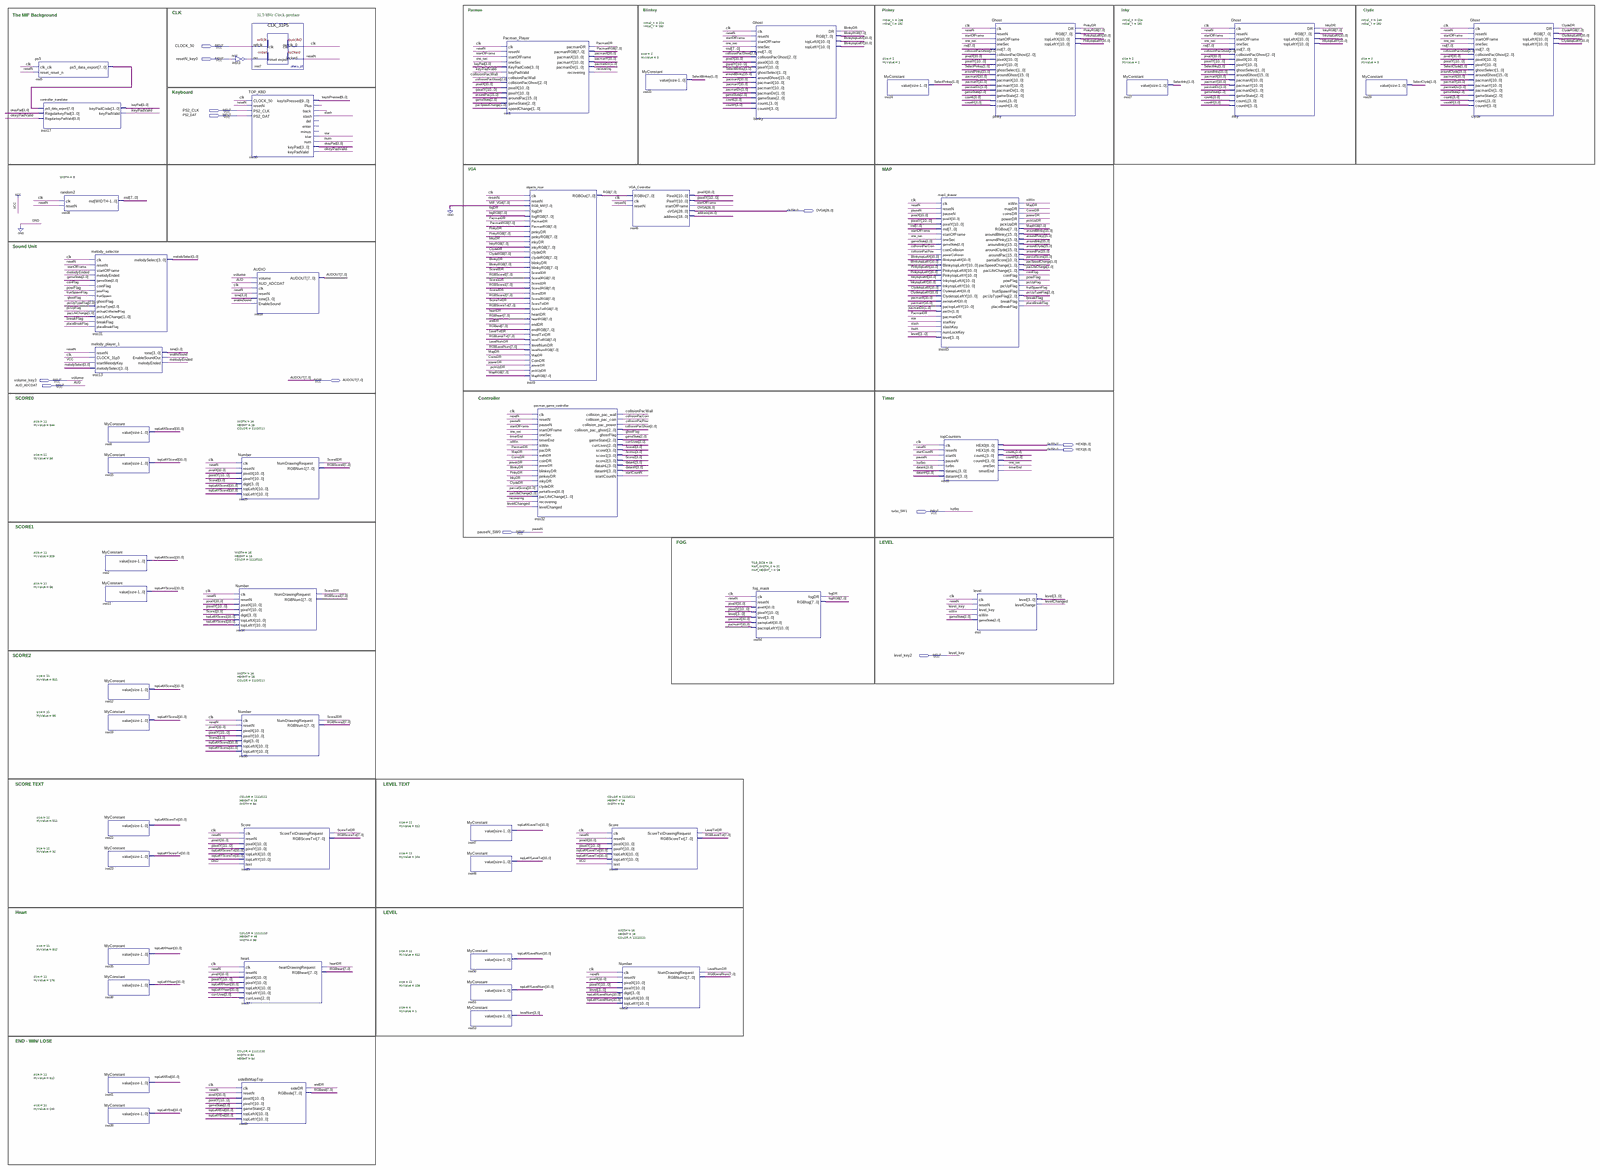
[diagram p0: schematic sheet, whole]
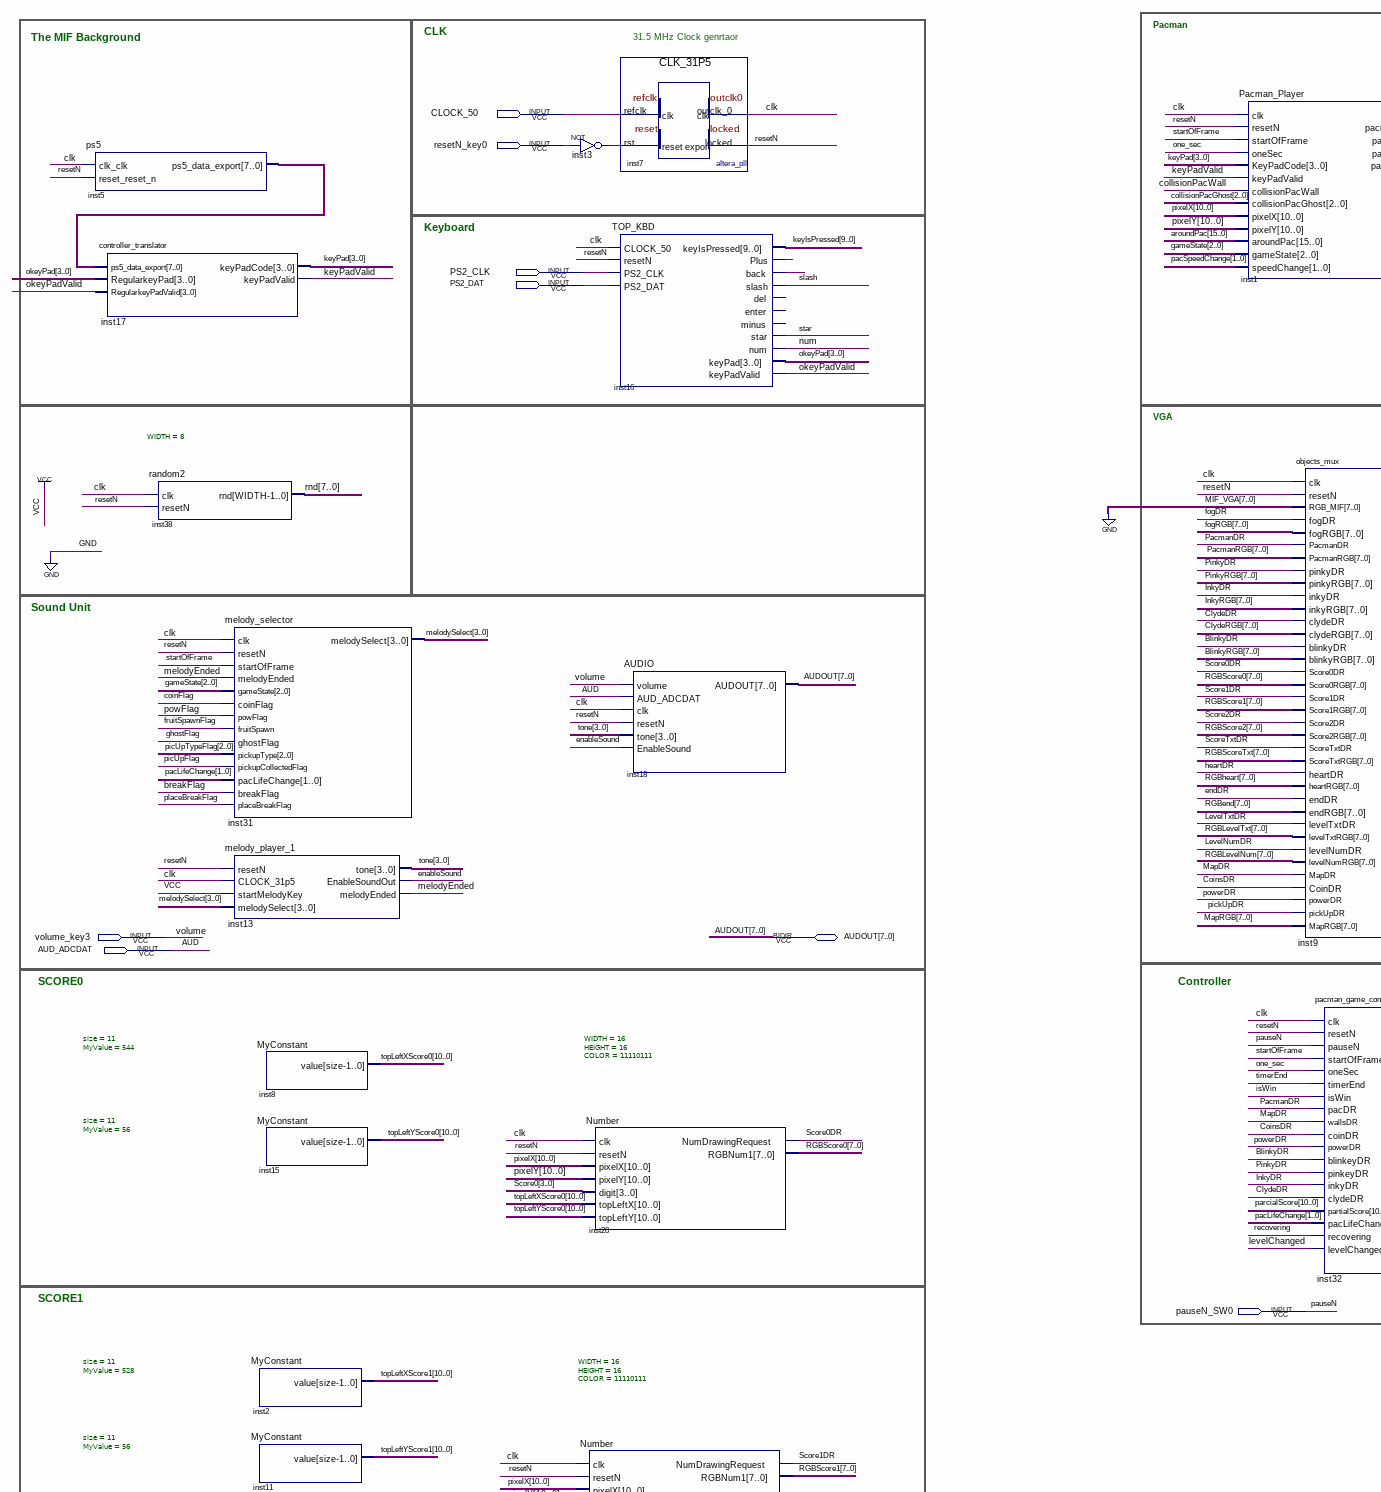
[diagram p1: schematic sheet, upper left part]
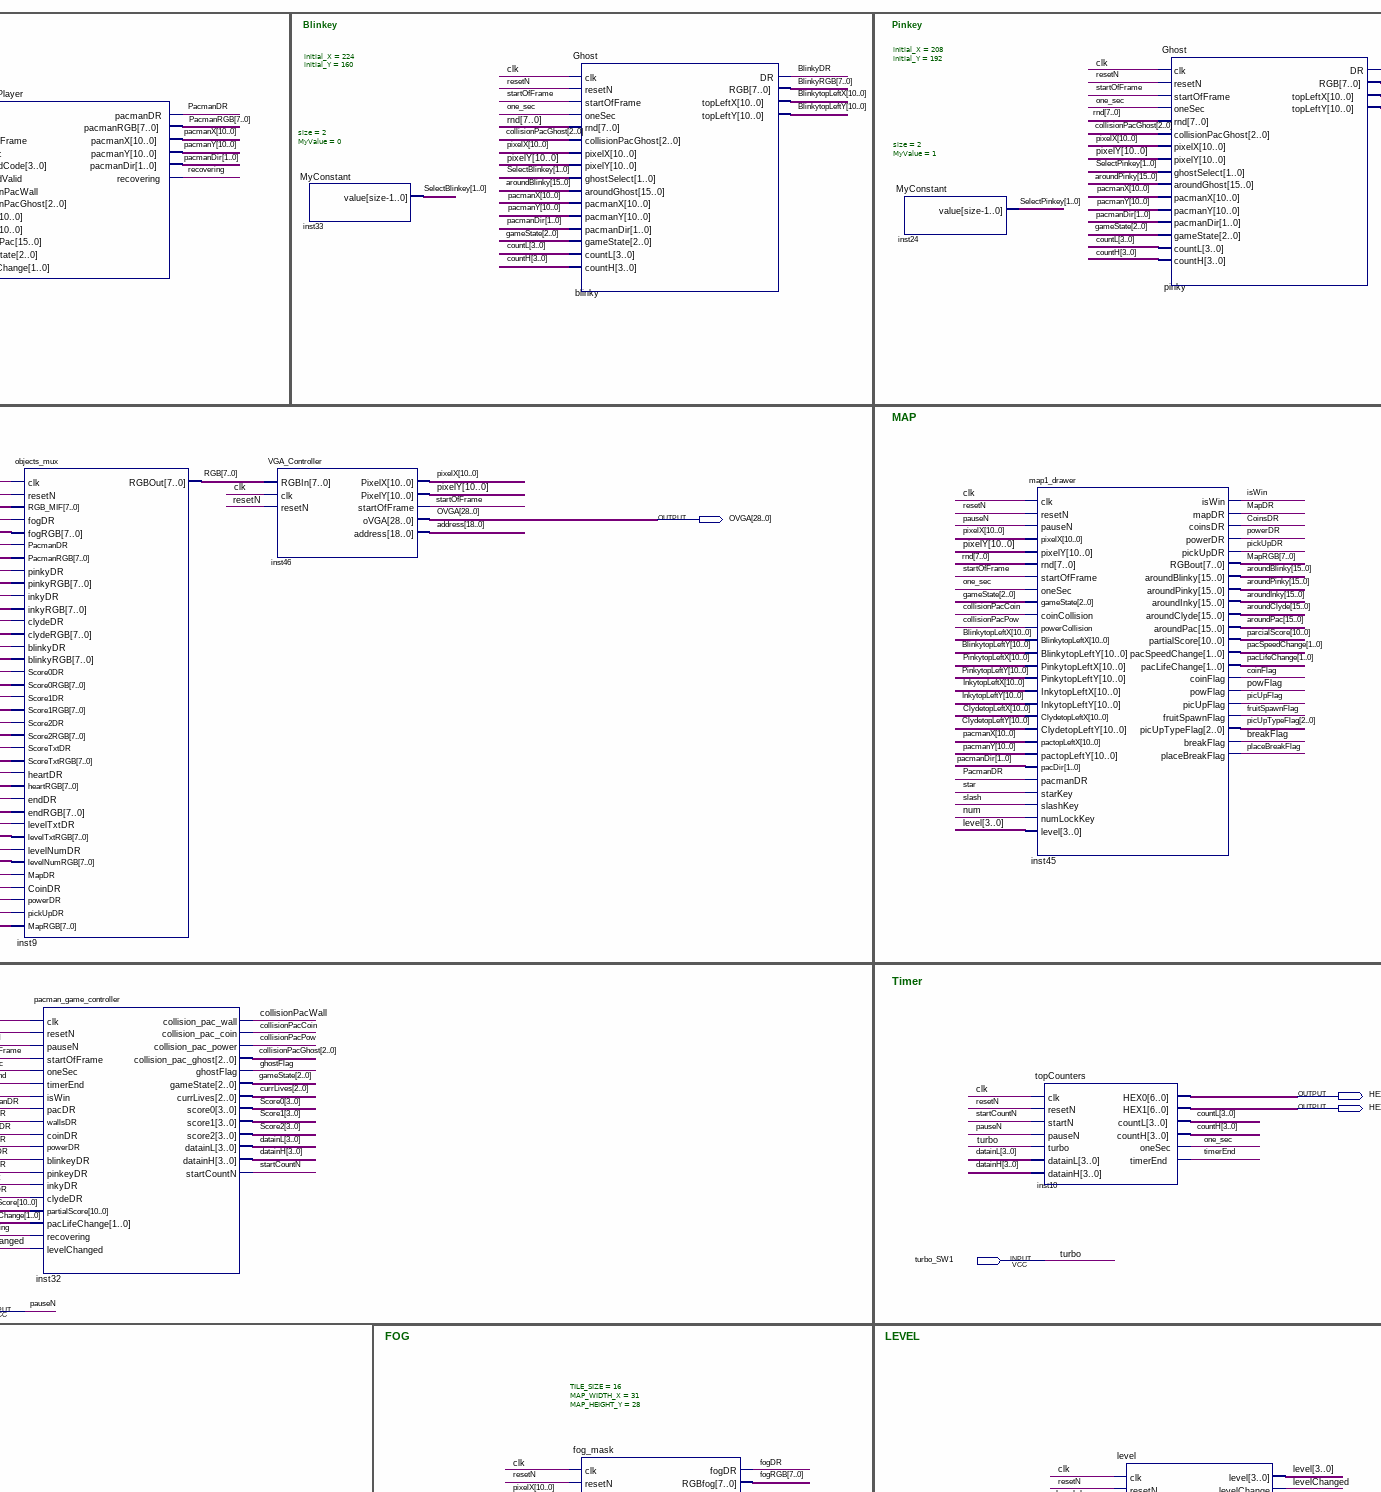
[diagram p2: schematic sheet, upper centre part]
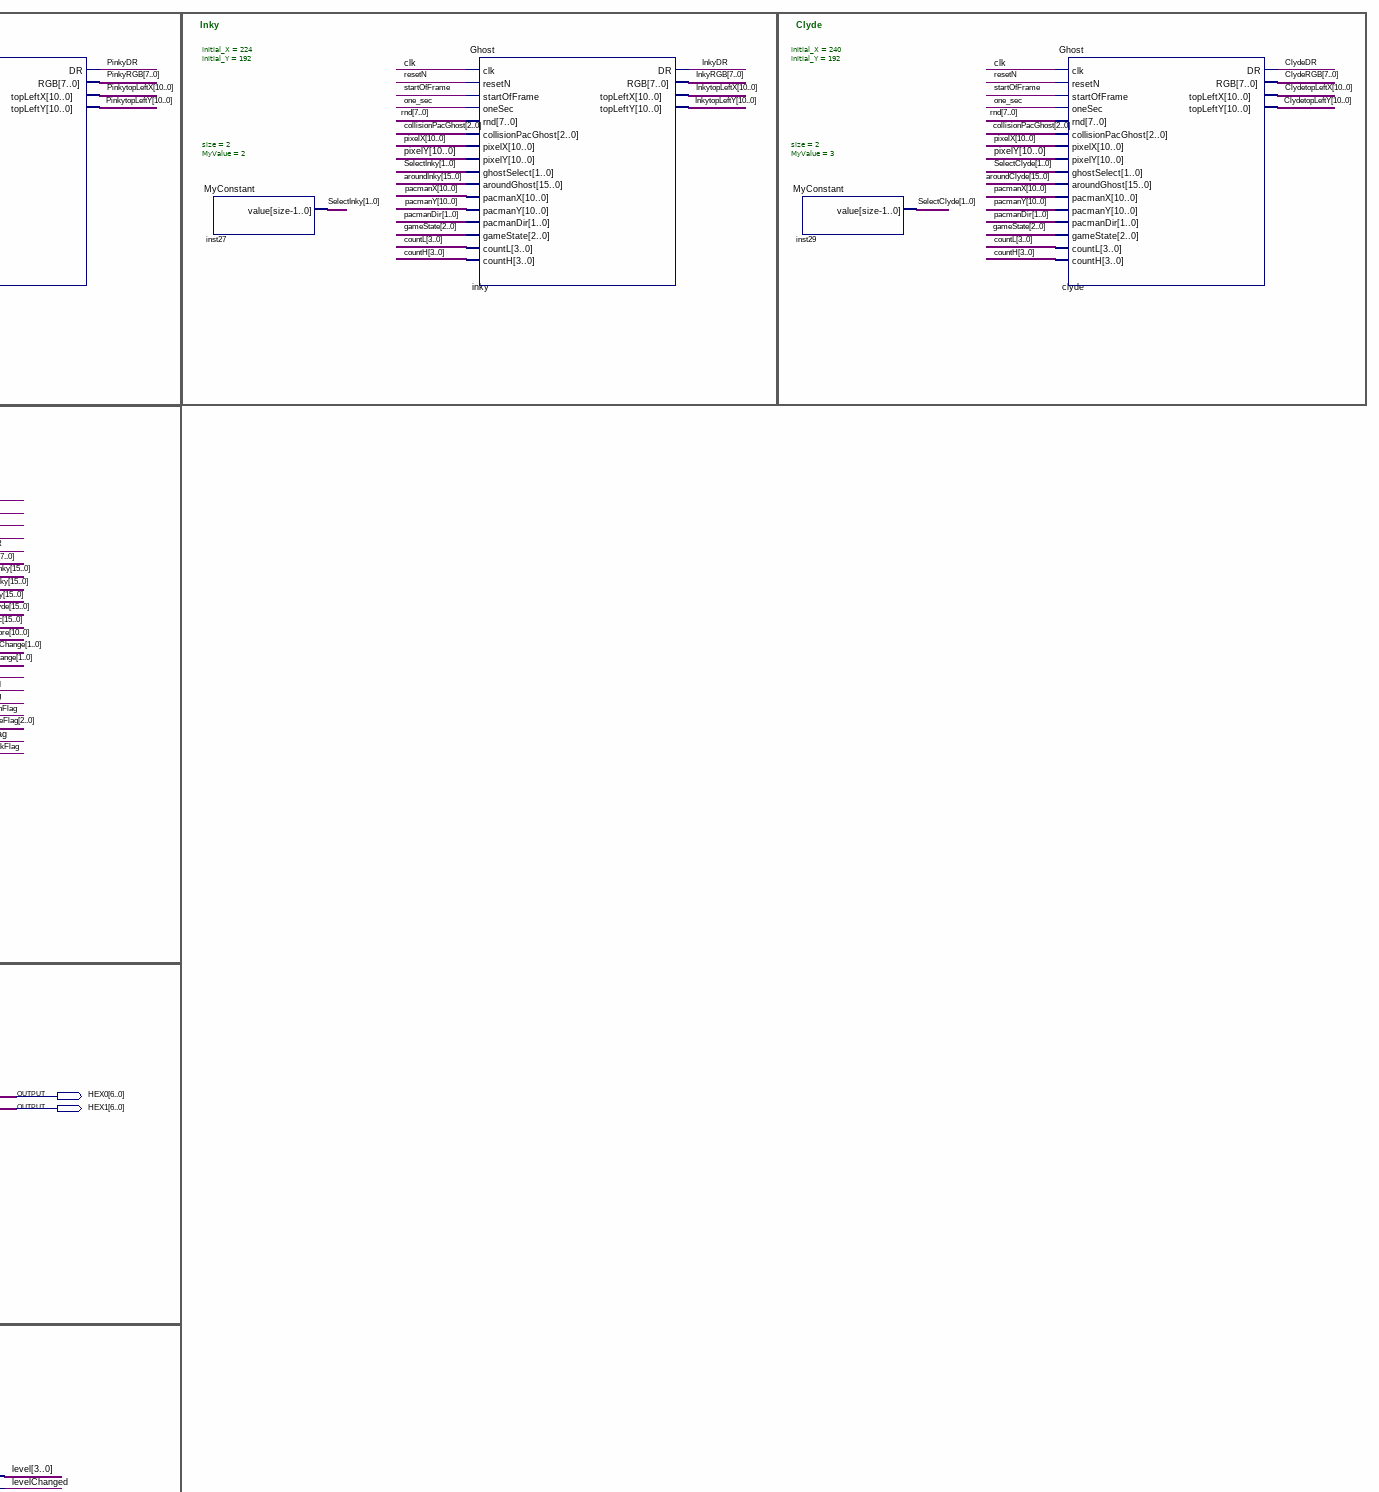
[diagram p3: schematic sheet, upper right part]
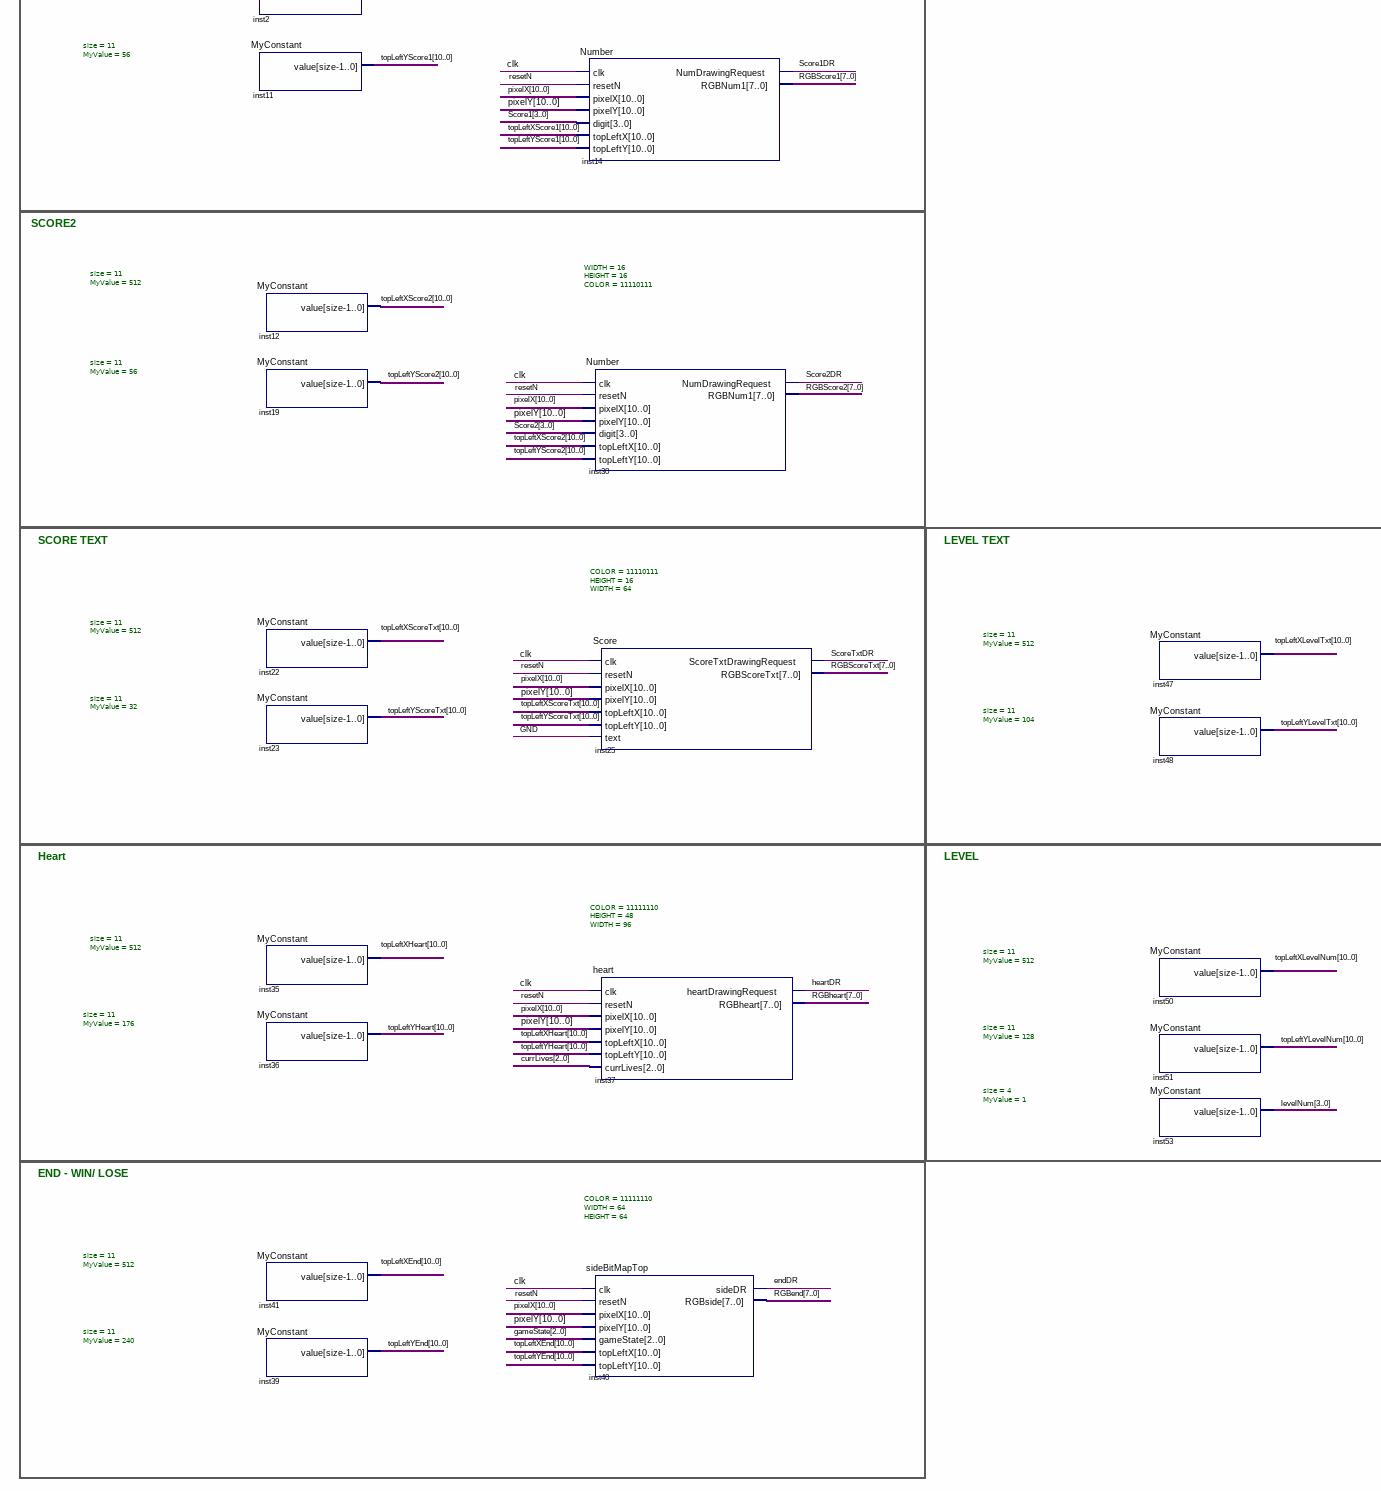
[diagram p4: schematic sheet, lower left part]
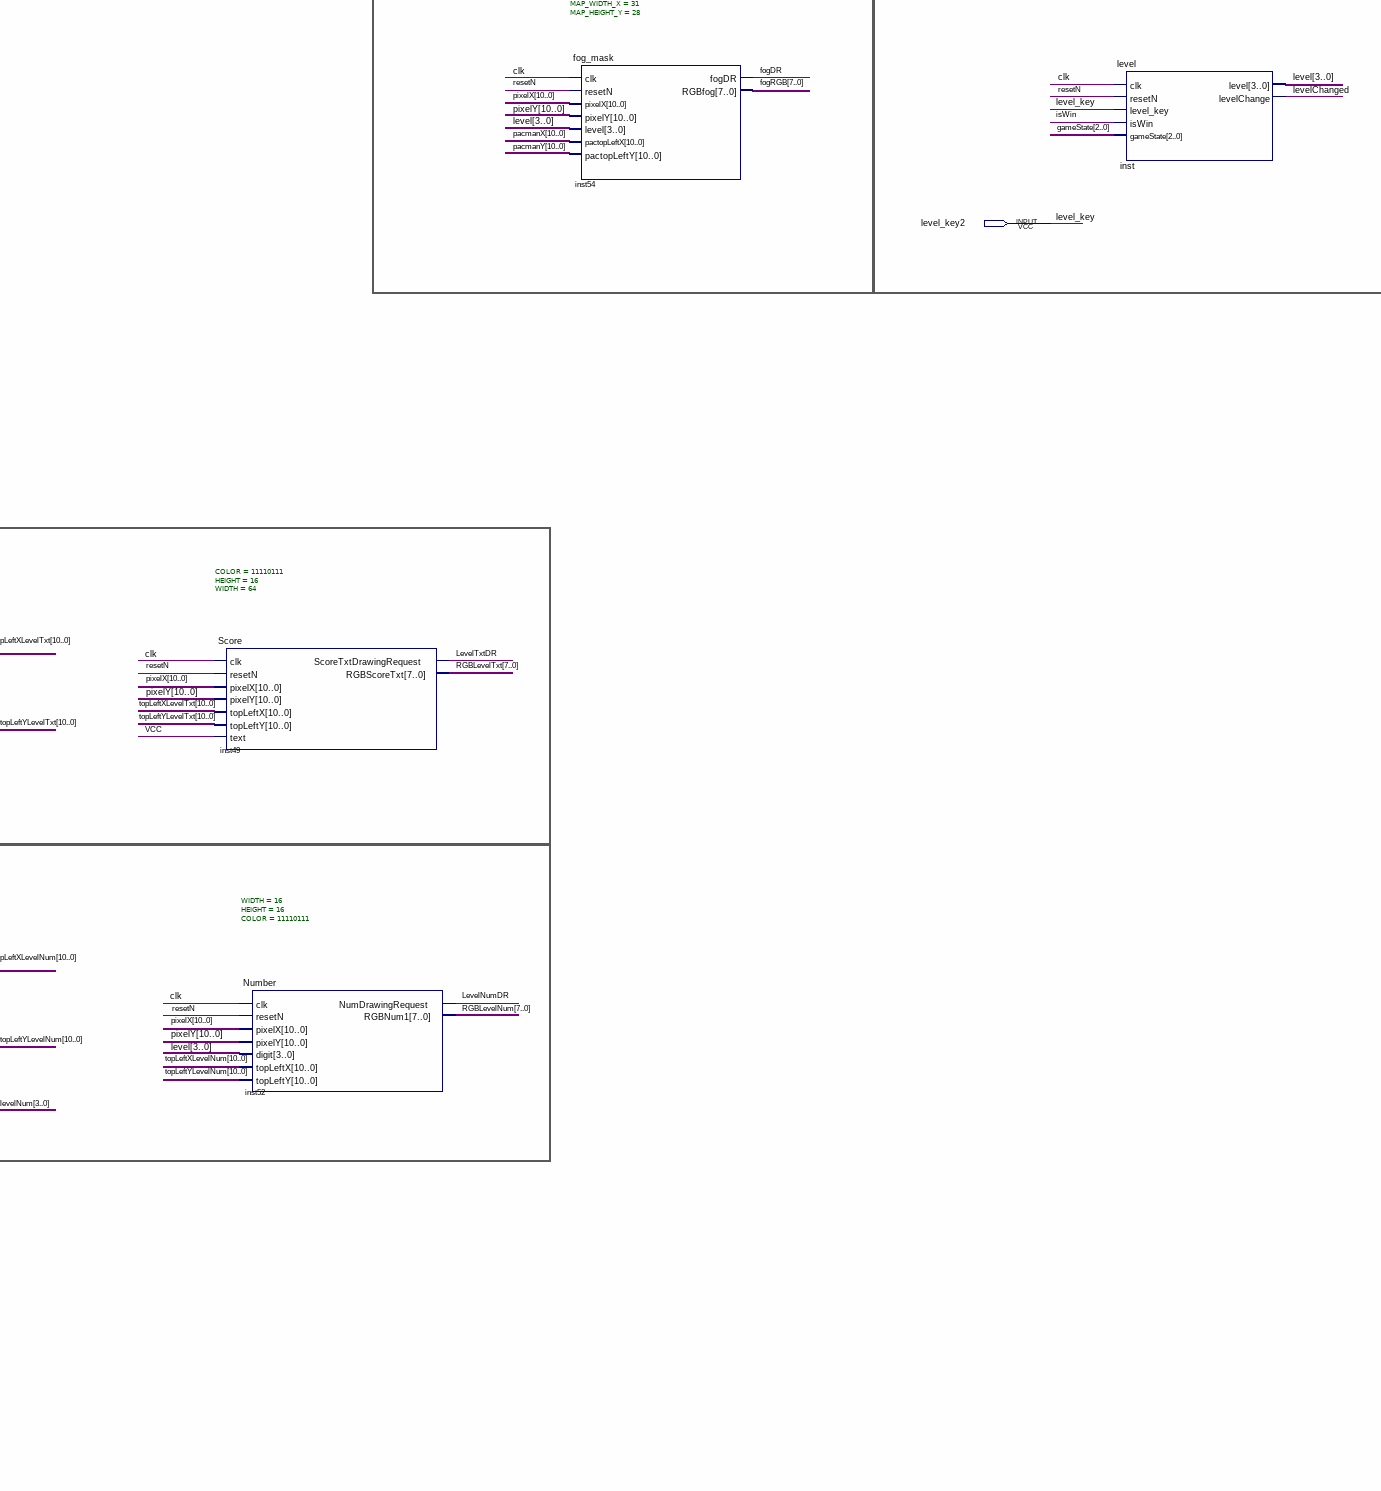
[diagram p5: schematic sheet, lower centre part]
// Quartus schematic Pacman.bdf as structural Verilog: 50 symbols, 13 pins
module Pacman (
  input  CLOCK_50,
  input  resetN_key0,
  input  PS2_CLK,
  input  PS2_DAT,
  input  volume_key3,
  input  AUD_ADCDAT,
  input  turbo_SW1,
  input  pauseN_SW0,
  input  level_key2,
  inout  [7:0] AUDOUT,
  output [28:0] OVGA,
  output [6:0] HEX0,
  output [6:0] HEX1
);

  wire BlinkyDR, breakFlag, clk, ClydeDR, coinFlag, CoinsDR, collisionPacCoin, collisionPacPow,
       collisionPacWall, enableSound, endDR, fogDR, fruitSpawnFlag, ghostFlag, heartDR, InkyDR, inst3_out,
       inst16_back, inst16_plus, isWin, keyPadValid, levelChanged, LevelNumDR, LevelTxtDR, MapDR,
       melodyEnded, num, okeyPadValid, one_sec, PacmanDR, pickUpDR, picUpFlag, PinkyDR, placeBreakFlag,
       powerDR, powFlag, recovering, resetN, Score0DR, Score1DR, Score2DR, ScoreTxtDR, slash, star,
       startCountN, startOfFrame, timerEnd;
  wire [1:0] pacLifeChange, pacmanDir, pacSpeedChange, SelectBlinkey, SelectClyde, SelectInky, SelectPinkey;
  wire [2:0] collisionPacGhost, currLives, gameState, picUpTypeFlag;
  wire [3:0] countH, countL, datainH, datainL, keyPad, level, levelNum, melodySelect, okeyPad, Score0,
       Score1, Score2, tone;
  wire [7:0] BlinkyRGB, ClydeRGB, fogRGB, InkyRGB, inst5_ps5_data_export, MapRGB, PacmanRGB, PinkyRGB, RGB,
       RGBend, RGBheart, RGBLevelNum, RGBLevelTxt, RGBScore0, RGBScore1, RGBScore2, RGBScoreTxt, rnd;
  wire [9:0] keyIsPressed;
  wire [10:0] BlinkytopLeftX, BlinkytopLeftY, ClydetopLeftX, ClydetopLeftY, InkytopLeftX, InkytopLeftY,
       pacmanX, pacmanY, parcialScore, PinkytopLeftX, PinkytopLeftY, pixelX, pixelY, topLeftXEnd,
       topLeftXHeart, topLeftXLevelNum, topLeftXLevelTxt, topLeftXScore0, topLeftXScore1, topLeftXScore2,
       topLeftXScoreTxt, topLeftYEnd, topLeftYHeart, topLeftYLevelNum, topLeftYLevelTxt, topLeftYScore0,
       topLeftYScore1, topLeftYScore2, topLeftYScoreTxt;
  wire [15:0] aroundBlinky, aroundClyde, aroundInky, aroundPac, aroundPinky;
  wire [18:0] address;

  ps5 inst5 (.clk_clk(clk), .reset_reset_n(resetN), .ps5_data_export(inst5_ps5_data_export));
  controller_translator inst17 (
    .ps5_data_export(inst5_ps5_data_export), .RegularkeyPad(okeyPad), .RegularkeyPadValid({4{okeyPadValid}}),
    .keyPadCode(keyPad), .keyPadValid(keyPadValid));
  random2 #(.WIDTH(8)) inst38 (.clk(clk), .resetN(resetN), .rnd(rnd));
  melody_selector inst31 (
    .clk(clk), .resetN(resetN), .startOfFrame(startOfFrame), .melodyEnded(melodyEnded),
    .gameState(gameState), .coinFlag(coinFlag), .powFlag(powFlag), .fruitSpawn(fruitSpawnFlag),
    .ghostFlag(ghostFlag), .pickupType(picUpTypeFlag), .pickupCollectedFlag(picUpFlag),
    .pacLifeChange(pacLifeChange), .breakFlag(breakFlag), .placeBreakFlag(placeBreakFlag),
    .melodySelect(melodySelect));
  melody_player_1 inst13 (
    .resetN(resetN), .CLOCK_31p5(clk), .startMelodyKey(1'b1), .melodySelect(melodySelect), .tone(tone),
    .EnableSoundOut(enableSound), .melodyEnded(melodyEnded));
  MyConstant #(.size(11), .MyValue(544)) inst8 (.value(topLeftXScore0));
  MyConstant #(.size(11), .MyValue(56)) inst15 (.value(topLeftYScore0));
  MyConstant #(.size(11), .MyValue(528)) inst2 (.value(topLeftXScore1));
  MyConstant #(.size(11), .MyValue(56)) inst11 (.value(topLeftYScore1));
  MyConstant #(.size(11), .MyValue(512)) inst12 (.value(topLeftXScore2));
  MyConstant #(.size(11), .MyValue(56)) inst19 (.value(topLeftYScore2));
  MyConstant #(.size(11), .MyValue(512)) inst22 (.value(topLeftXScoreTxt));
  MyConstant #(.size(11), .MyValue(32)) inst23 (.value(topLeftYScoreTxt));
  MyConstant #(.size(11), .MyValue(512)) inst35 (.value(topLeftXHeart));
  MyConstant #(.size(11), .MyValue(176)) inst36 (.value(topLeftYHeart));
  MyConstant #(.size(11), .MyValue(512)) inst41 (.value(topLeftXEnd));
  MyConstant #(.size(11), .MyValue(240)) inst39 (.value(topLeftYEnd));
  not inst3 (inst3_out, resetN_key0);
  Number #(.WIDTH(16), .HEIGHT(16), .COLOR(11110111)) inst14 (
    .clk(clk), .resetN(resetN), .pixelX(pixelX), .pixelY(pixelY), .digit(Score1), .topLeftX(topLeftXScore1),
    .topLeftY(topLeftYScore1), .NumDrawingRequest(Score1DR), .RGBNum1(RGBScore1));
  CLK_31P5 inst7 (.refclk(CLOCK_50), .rst(inst3_out), .outclk_0(clk), .locked(resetN));
  TOP_KBD inst16 (
    .CLOCK_50(clk), .resetN(resetN), .PS2_CLK(PS2_CLK), .PS2_DAT(PS2_DAT), .keyIsPressed(keyIsPressed),
    .Plus(inst16_plus), .back(inst16_back), .slash(slash), .star(star), .num(num), .keyPad(okeyPad),
    .keyPadValid(okeyPadValid));  // open: del, enter, minus
  AUDIO inst18 (
    .volume(volume_key3), .AUD_ADCDAT(AUD_ADCDAT), .clk(clk), .resetN(resetN), .tone(tone),
    .EnableSound(enableSound), .AUDOUT(AUDOUT));
  Number #(.WIDTH(16), .HEIGHT(16), .COLOR(11110111)) inst20 (
    .clk(clk), .resetN(resetN), .pixelX(pixelX), .pixelY(pixelY), .digit(Score0), .topLeftX(topLeftXScore0),
    .topLeftY(topLeftYScore0), .NumDrawingRequest(Score0DR), .RGBNum1(RGBScore0));
  Number #(.WIDTH(16), .HEIGHT(16), .COLOR(11110111)) inst30 (
    .clk(clk), .resetN(resetN), .pixelX(pixelX), .pixelY(pixelY), .digit(Score2), .topLeftX(topLeftXScore2),
    .topLeftY(topLeftYScore2), .NumDrawingRequest(Score2DR), .RGBNum1(RGBScore2));
  Score #(.COLOR(11110111), .HEIGHT(16), .WIDTH(64)) inst25 (
    .clk(clk), .resetN(resetN), .pixelX(pixelX), .pixelY(pixelY), .topLeftX(topLeftXScoreTxt),
    .topLeftY(topLeftYScoreTxt), .text(1'b0), .ScoreTxtDrawingRequest(ScoreTxtDR), .RGBScoreTxt(RGBScoreTxt));
  heart #(.COLOR(11111110), .HEIGHT(48), .WIDTH(96)) inst37 (
    .clk(clk), .resetN(resetN), .pixelX(pixelX), .pixelY(pixelY), .topLeftX(topLeftXHeart),
    .topLeftY(topLeftYHeart), .currLives(currLives), .heartDrawingRequest(heartDR), .RGBheart(RGBheart));
  sideBitMapTop #(.COLOR(11111110), .WIDTH(64), .HEIGHT(64)) inst40 (
    .clk(clk), .resetN(resetN), .pixelX(pixelX), .pixelY(pixelY), .gameState(gameState),
    .topLeftX(topLeftXEnd), .topLeftY(topLeftYEnd), .sideDR(endDR), .RGBside(RGBend));
  MyConstant #(.size(11), .MyValue(512)) inst47 (.value(topLeftXLevelTxt));
  MyConstant #(.size(11), .MyValue(104)) inst48 (.value(topLeftYLevelTxt));
  MyConstant #(.size(11), .MyValue(512)) inst50 (.value(topLeftXLevelNum));
  MyConstant #(.size(11), .MyValue(128)) inst51 (.value(topLeftYLevelNum));
  MyConstant #(.size(4), .MyValue(1)) inst53 (.value(levelNum));
  Pacman_Player inst1 (
    .clk(clk), .resetN(resetN), .startOfFrame(startOfFrame), .oneSec(one_sec), .KeyPadCode(keyPad),
    .keyPadValid(keyPadValid), .collisionPacWall(collisionPacWall), .collisionPacGhost(collisionPacGhost),
    .pixelX(pixelX), .pixelY(pixelY), .aroundPac(aroundPac), .gameState(gameState),
    .speedChange(pacSpeedChange), .pacmanDR(PacmanDR), .pacmanRGB(PacmanRGB), .pacmanX(pacmanX),
    .pacmanY(pacmanY), .pacmanDir(pacmanDir), .recovering(recovering));
  objects_mux inst9 (
    .clk(clk), .resetN(resetN), .RGB_MIF({8{1'b0}}), .fogDR(fogDR), .fogRGB(fogRGB), .PacmanDR(PacmanDR),
    .PacmanRGB(PacmanRGB), .pinkyDR(PinkyDR), .pinkyRGB(PinkyRGB), .inkyDR(InkyDR), .inkyRGB(InkyRGB),
    .clydeDR(ClydeDR), .clydeRGB(ClydeRGB), .blinkyDR(BlinkyDR), .blinkyRGB(BlinkyRGB), .Score0DR(Score0DR),
    .Score0RGB(RGBScore0), .Score1DR(Score1DR), .Score1RGB(RGBScore1), .Score2DR(Score2DR),
    .Score2RGB(RGBScore2), .ScoreTxtDR(ScoreTxtDR), .ScoreTxtRGB(RGBScoreTxt), .heartDR(heartDR),
    .heartRGB(RGBheart), .endDR(endDR), .endRGB(RGBend), .levelTxtDR(LevelTxtDR), .levelTxtRGB(RGBLevelTxt),
    .levelNumDR(LevelNumDR), .levelNumRGB(RGBLevelNum), .MapDR(MapDR), .CoinDR(CoinsDR), .powerDR(powerDR),
    .pickUpDR(pickUpDR), .MapRGB(MapRGB), .RGBOut(RGB));
  pacman_game_controller inst32 (
    .clk(clk), .resetN(resetN), .pauseN(pauseN_SW0), .startOfFrame(startOfFrame), .oneSec(one_sec),
    .timerEnd(timerEnd), .isWin(isWin), .pacDR(PacmanDR), .wallsDR(MapDR), .coinDR(CoinsDR),
    .powerDR(powerDR), .blinkeyDR(BlinkyDR), .pinkeyDR(PinkyDR), .inkyDR(InkyDR), .clydeDR(ClydeDR),
    .partialScore(parcialScore), .pacLifeChange(pacLifeChange), .recovering(recovering),
    .levelChanged(levelChanged), .collision_pac_wall(collisionPacWall),
    .collision_pac_coin(collisionPacCoin), .collision_pac_power(collisionPacPow),
    .collision_pac_ghost(collisionPacGhost), .ghostFlag(ghostFlag), .gameState(gameState),
    .currLives(currLives), .score0(Score0), .score1(Score1), .score2(Score2), .datainL(datainL),
    .datainH(datainH), .startCountN(startCountN));
  Score #(.COLOR(11110111), .HEIGHT(16), .WIDTH(64)) inst49 (
    .clk(clk), .resetN(resetN), .pixelX(pixelX), .pixelY(pixelY), .topLeftX(topLeftXLevelTxt),
    .topLeftY(topLeftYLevelTxt), .text(1'b1), .ScoreTxtDrawingRequest(LevelTxtDR), .RGBScoreTxt(RGBLevelTxt));
  Number #(.WIDTH(16), .HEIGHT(16), .COLOR(11110111)) inst52 (
    .clk(clk), .resetN(resetN), .pixelX(pixelX), .pixelY(pixelY), .digit(level), .topLeftX(topLeftXLevelNum),
    .topLeftY(topLeftYLevelNum), .NumDrawingRequest(LevelNumDR), .RGBNum1(RGBLevelNum));
  MyConstant #(.size(2), .MyValue(0)) inst33 (.value(SelectBlinkey));
  VGA_Controller inst46 (
    .RGBIn(RGB), .clk(clk), .resetN(resetN), .PixelX(pixelX), .PixelY(pixelY), .startOfFrame(startOfFrame),
    .oVGA(OVGA), .address(address));
  Ghost #(.initial_X(224), .initial_Y(160)) blinky (
    .clk(clk), .resetN(resetN), .startOfFrame(startOfFrame), .oneSec(one_sec), .rnd(rnd),
    .collisionPacGhost(collisionPacGhost), .pixelX(pixelX), .pixelY(pixelY), .ghostSelect(SelectBlinkey),
    .aroundGhost(aroundBlinky), .pacmanX(pacmanX), .pacmanY(pacmanY), .pacmanDir(pacmanDir),
    .gameState(gameState), .countL(countL), .countH(countH), .DR(BlinkyDR), .RGB(BlinkyRGB),
    .topLeftX(BlinkytopLeftX), .topLeftY(BlinkytopLeftY));
  fog_mask #(.TILE_SIZE(16), .MAP_WIDTH_X(31), .MAP_HEIGHT_Y(28)) inst54 (
    .clk(clk), .resetN(resetN), .pixelX(pixelX), .pixelY(pixelY), .level(level), .pactopLeftX(pacmanX),
    .pactopLeftY(pacmanY), .fogDR(fogDR), .RGBfog(fogRGB));
  MyConstant #(.size(2), .MyValue(1)) inst24 (.value(SelectPinkey));
  map1_drawer inst45 (
    .clk(clk), .resetN(resetN), .pauseN(pauseN_SW0), .pixelX(pixelX), .pixelY(pixelY), .rnd(rnd),
    .startOfFrame(startOfFrame), .oneSec(one_sec), .gameState(gameState), .coinCollision(collisionPacCoin),
    .powerCollision(collisionPacPow), .BlinkytopLeftX(BlinkytopLeftX), .BlinkytopLeftY(BlinkytopLeftY),
    .PinkytopLeftX(PinkytopLeftX), .PinkytopLeftY(PinkytopLeftY), .InkytopLeftX(InkytopLeftX),
    .InkytopLeftY(InkytopLeftY), .ClydetopLeftX(ClydetopLeftX), .ClydetopLeftY(ClydetopLeftY),
    .pactopLeftX(pacmanX), .pactopLeftY(pacmanY), .pacDir(pacmanDir), .pacmanDR(PacmanDR), .starKey(star),
    .slashKey(slash), .numLockKey(num), .level(level), .isWin(isWin), .mapDR(MapDR), .coinsDR(CoinsDR),
    .powerDR(powerDR), .pickUpDR(pickUpDR), .RGBout(MapRGB), .aroundBlinky(aroundBlinky),
    .aroundPinky(aroundPinky), .aroundInky(aroundInky), .aroundClyde(aroundClyde), .aroundPac(aroundPac),
    .partialScore(parcialScore), .pacSpeedChange(pacSpeedChange), .pacLifeChange(pacLifeChange),
    .coinFlag(coinFlag), .powFlag(powFlag), .picUpFlag(picUpFlag), .fruitSpawnFlag(fruitSpawnFlag),
    .picUpTypeFlag(picUpTypeFlag), .breakFlag(breakFlag), .placeBreakFlag(placeBreakFlag));
  topCounters inst10 (
    .clk(clk), .resetN(resetN), .startN(startCountN), .pauseN(pauseN_SW0), .turbo(turbo_SW1),
    .datainL(datainL), .datainH(datainH), .HEX0(HEX0), .HEX1(HEX1), .countL(countL), .countH(countH),
    .oneSec(one_sec), .timerEnd(timerEnd));
  level inst (
    .clk(clk), .resetN(resetN), .level_key(level_key2), .isWin(isWin), .gameState(gameState), .level(level),
    .levelChange(levelChanged));
  Ghost #(.initial_X(208), .initial_Y(192)) pinky (
    .clk(clk), .resetN(resetN), .startOfFrame(startOfFrame), .oneSec(one_sec), .rnd(rnd),
    .collisionPacGhost(collisionPacGhost), .pixelX(pixelX), .pixelY(pixelY), .ghostSelect(SelectPinkey),
    .aroundGhost(aroundPinky), .pacmanX(pacmanX), .pacmanY(pacmanY), .pacmanDir(pacmanDir),
    .gameState(gameState), .countL(countL), .countH(countH), .DR(PinkyDR), .RGB(PinkyRGB),
    .topLeftX(PinkytopLeftX), .topLeftY(PinkytopLeftY));
  MyConstant #(.size(2), .MyValue(2)) inst27 (.value(SelectInky));
  Ghost #(.initial_X(224), .initial_Y(192)) inky (
    .clk(clk), .resetN(resetN), .startOfFrame(startOfFrame), .oneSec(one_sec), .rnd(rnd),
    .collisionPacGhost(collisionPacGhost), .pixelX(pixelX), .pixelY(pixelY), .ghostSelect(SelectInky),
    .aroundGhost(aroundInky), .pacmanX(pacmanX), .pacmanY(pacmanY), .pacmanDir(pacmanDir),
    .gameState(gameState), .countL(countL), .countH(countH), .DR(InkyDR), .RGB(InkyRGB),
    .topLeftX(InkytopLeftX), .topLeftY(InkytopLeftY));
  MyConstant #(.size(2), .MyValue(3)) inst29 (.value(SelectClyde));
  Ghost #(.initial_X(240), .initial_Y(192)) clyde (
    .clk(clk), .resetN(resetN), .startOfFrame(startOfFrame), .oneSec(one_sec), .rnd(rnd),
    .collisionPacGhost(collisionPacGhost), .pixelX(pixelX), .pixelY(pixelY), .ghostSelect(SelectClyde),
    .aroundGhost(aroundClyde), .pacmanX(pacmanX), .pacmanY(pacmanY), .pacmanDir(pacmanDir),
    .gameState(gameState), .countL(countL), .countH(countH), .DR(ClydeDR), .RGB(ClydeRGB),
    .topLeftX(ClydetopLeftX), .topLeftY(ClydetopLeftY));

  // Other names for the same wires on the sheet: AUD = AUD_ADCDAT; level_key = level_key2; pauseN = pauseN_SW0;
  //   turbo = turbo_SW1; volume = volume_key3

  // Notes on the sheet:
  //   Pacman
  //   Blinkey
  //   Pinkey
  //   Inky
  //   Clyde
  //   CLK
  //   The MIF Background
  //   31.5 MHz Clock genrtaor
  //   Keyboard
  //   VGA
  //   MAP
  //   Sound Unit
  //   SCORE0
  //   Controller
  //   Timer
  //   SCORE1
  //   FOG
  //   LEVEL
  //   SCORE2
  //   SCORE TEXT
  //   LEVEL TEXT
  //   Heart
  //   LEVEL
  //   END - WIN/ LOSE
endmodule
